# Altium schematic sheet MCU.SchDoc
size A3; DocumentNumber: 5; SheetNumber: 5; SheetTotal: 12
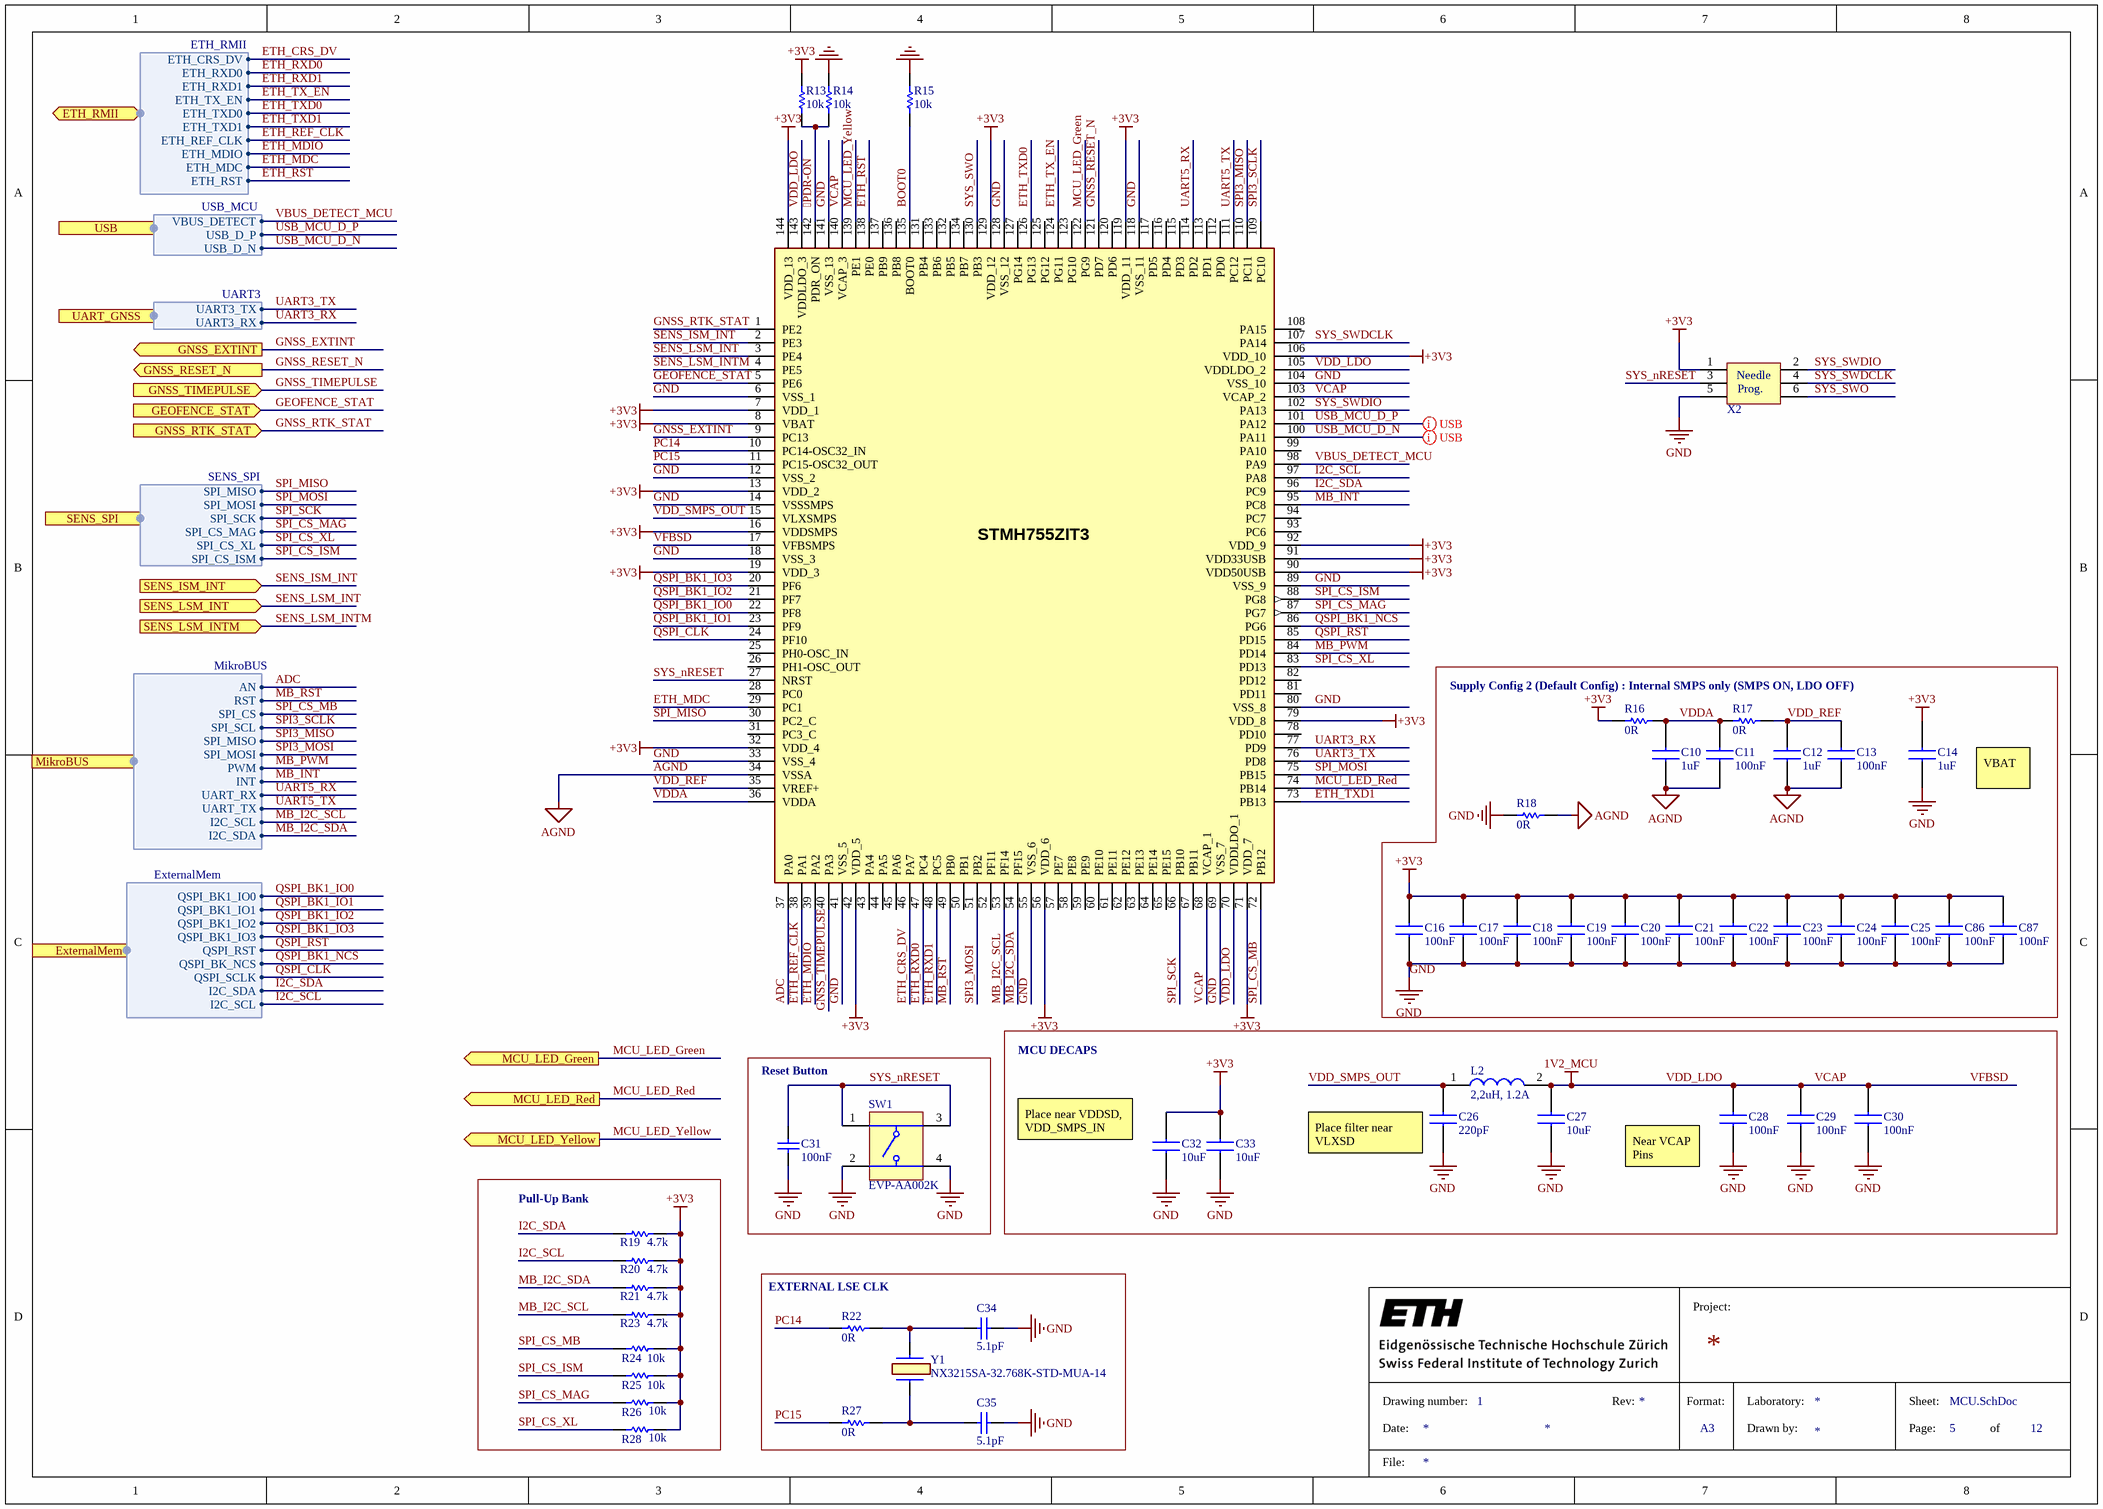
[diagram p0: MCU.SchDoc]

## Parts
C10  1uF  [CAPC1608X90N]
C11  100nF  [CAPC1608X90N]
C12  1uF  [CAPC1608X90N]
C13  100nF  [CAPC1608X90N]
C14  1uF  [CAPC1608X90N]
C16  100nF  [CAPC1608X90N]
C17  100nF  [CAPC1608X90N]
C18  100nF  [CAPC1608X90N]
C19  100nF  [CAPC1608X90N]
C20  100nF  [CAPC1608X90N]
C21  100nF  [CAPC1608X90N]
C22  100nF  [CAPC1608X90N]
C23  100nF  [CAPC1608X90N]
C24  100nF  [CAPC1608X90N]
C25  100nF  [CAPC1608X90N]
C26  220pF  [CAPC1608X87N]
C27  10uF  [CAPC2013X140N]
C28  100nF  [CAPC1608X90N]
C29  100nF  [CAPC1608X90N]
C30  100nF  [CAPC1608X90N]
C31  100nF  [CAPC1005X55X25ML05T10]
C32  10uF  [CAPC2013X140N]
C33  10uF  [CAPC2013X140N]
C34  5.1pF  [CAPC1005X55X25NL05T10]
C35  5.1pF  [CAPC1005X55X25NL05T10]
C86  100nF  [CAPC1608X90N]
C87  100nF  [CAPC1608X90N]
IC1  STM32H755ZIT3  [QFP50P2200X2200X160-144N]  (value not drawn)
L2  2,2uH, 1.2A  [LQM2MPN1R0NG0L]
R13  10k  [RESC2012X70N]
R14  10k  [RESC2012X70N]
R15  10k  [RESC2012X70N]
R16  0R  [RESC1005X40X25LL05T10]
R17  0R  [RESC1005X40X25LL05T10]
R18  0R  [RESC1005X40X25LL05T10]
R19  4.7k  [RESC1005X40X25LL05T05]
R20  4.7k  [RESC1005X40X25LL05T05]
R21  4.7k  [RESC1005X40X25LL05T05]
R22  0R  [RESC1005X40X25LL05T10]
R23  4.7k  [RESC1005X40X25LL05T05]
R24  10k  [RESC2012X70N]
R25  10k  [RESC2012X70N]
R26  10k  [RESC2012X70N]
R27  0R  [RESC1005X40X25LL05T10]
R28  10k  [RESC2012X70N]
SW1  EVP-AA002K  [PNSC-EVPAA_V]
X2  TC2030-MCP-NL  [6-Pin_Needle_Programmer]  (value not drawn)  (no BOM)
Y1  NX3215SA-32.768K-STD-MUA-14  [NX3215SA32768KSTDMUA8]

## Blocks framed on the sheet
MCU DECAPS: C26-C30 C32 C33 L2
Reset Button: C31 SW1
Pull-Up Bank: R19-R21 R23-R26 R28
EXTERNAL LSE CLK: C34 C35 R22 R27 Y1

## Ports
ETH_RMII (bidir, harness ETH_RMII, see MAIN[4C], ETH[1A]), ExternalMem (harness ExternalMem, see MAIN[5A], Memory[1A]), GEOFENCE_STAT (in, see MAIN[5B], GNSS_ZED-X20P[2B], IndicatorLEDs[2A]), GNSS_EXTINT (out, see MAIN[5B], GNSS_ZED-X20P[1C]), GNSS_RESET_N (out, see MAIN[5B], GNSS_ZED-X20P[1C]), GNSS_RTK_STAT (in, see MAIN[5B], GNSS_ZED-X20P[2B], IndicatorLEDs[2A]), GNSS_TIMEPULSE (in, see MAIN[5B], GNSS_ZED-X20P[2B]), MCU_LED_Green (out, see MAIN[4D], IndicatorLEDs[1C]), MCU_LED_Red (out, see MAIN[4D], IndicatorLEDs[1C]), MCU_LED_Yellow (out, see MAIN[4D], IndicatorLEDs[1D]), MikroBUS (harness MikroBUS, see MAIN[4A], Mikro_Bus[1B]), SENS_ISM_INT (in, see MAIN[5A], SENS_MEMS[2B]), SENS_LSM_INT (in, see MAIN[5A], SENS_MEMS[3C]), SENS_LSM_INTM (in, see MAIN[5A], SENS_MEMS[3C]), SENS_SPI (harness SENS_SPI, see MAIN[5A], SENS_MEMS[1A]), UART_GNSS (harness UART3, see MAIN[5B], GNSS_ZED-X20P[1A]), USB (harness USB_MCU, see MAIN[5C], USB_C_MCU[4B])

## Harnesses
ETH_RMII: ETH_REF_CLK, ETH_MDIO, ETH_MDC, ETH_CRS_DV, ETH_TX_EN, ETH_RXD0, ETH_RXD1, ETH_TXD0, ETH_TXD1, ETH_RST
USB_MCU: USB_D_P, USB_D_N, VBUS_DETECT
ExternalMem: QSPI_BK1_IO0, QSPI_BK1_IO1, QSPI_BK1_IO2, QSPI_BK1_IO3, QSPI_RST, QSPI_BK_NCS, QSPI_SCLK, I2C_SDA, I2C_SCL
SENS_SPI: SPI_SCK, SPI_MOSI, SPI_MISO, SPI_CS_MAG, SPI_CS_ISM, SPI_CS_XL
UART3: UART3_TX, UART3_RX
MikroBUS: AN, RST, SPI_CS, SPI_SCL, SPI_MISO, SPI_MOSI, PWM, INT, UART_RX, UART_TX, I2C_SCL, I2C_SDA

## Nets
+3V3: C14.2 C16.2 C17.2 C18.2 C19.2 C20.2 C21.2 C22.2 C23.2 C24.2 C25.2 C32.2 C33.2 C86.2 C87.2 IC1.7(VDD_1) IC1.8(VBAT) IC1.13(VDD_2) IC1.16(VDDSMPS) IC1.19(VDD_3) IC1.32(VDD_4) IC1.42(VDD_5) IC1.56(VDD_6) IC1.71(VDD_7) IC1.79(VDD_8) IC1.90(VDD50USB) IC1.91(VDD33USB) IC1.92(VDD_9) IC1.106(VDD_10) IC1.119(VDD_11) IC1.129(VDD_12) IC1.144(VDD_13) R13.2 R16.1 R19.2 R20.2 R21.2 R23.2 R24.2 R25.2 R26.2 R28.2 X2.1
AGND: C10.1 C11.1 C12.1 C13.1 IC1.34(VSSA) R18.2
GND: C14.1 C16.1 C17.1 C18.1 C19.1 C20.1 C21.1 C22.1 C23.1 C24.1 C25.1 C26.2 C27.1 C28.1 C29.1 C30.1 C31.1 C32.1 C33.1 C34.2 C35.2 C86.1 C87.1 IC1.6(VSS_1) IC1.12(VSS_2) IC1.14(VSSSMPS) IC1.18(VSS_3) IC1.33(VSS_4) IC1.41(VSS_5) IC1.55(VSS_6) IC1.69(VSS_7) IC1.80(VSS_8) IC1.89(VSS_9) IC1.104(VSS_10) IC1.118(VSS_11) IC1.128(VSS_12) IC1.141(VSS_13) R14.2 R15.2 R18.1 SW1.2(B) SW1.4(B') X2.5
VCAP: C27.2 C28.2 C29.2 C30.2 IC1.17(VFBSMPS) IC1.68(VCAP_1) IC1.70(VDDLDO_1) IC1.103(VCAP_2) IC1.105(VDDLDO_2) IC1.140(VCAP_3) IC1.143(VDDLDO_3) L2.2  [also labelled 1V2_MCU, VDD_LDO, VFBSD]
PDR-ON: IC1.142(PDR_ON) R13.1 R14.1
ADC: IC1.37(PA0) ; port MikroBUS.AN
BOOT0: IC1.135(BOOT0) R15.1
ETH_CRS_DV: IC1.46(PA7) ; port ETH_RMII.ETH_CRS_DV
ETH_MDC: IC1.29(PC1) ; port ETH_RMII.ETH_MDC
ETH_MDIO: IC1.39(PA2) ; port ETH_RMII.ETH_MDIO
ETH_REF_CLK: IC1.38(PA1) ; port ETH_RMII.ETH_REF_CLK
ETH_RST: IC1.138(PE0) ; port ETH_RMII.ETH_RST
ETH_RXD0: IC1.47(PC4) ; port ETH_RMII.ETH_RXD0
ETH_RXD1: IC1.48(PC5) ; port ETH_RMII.ETH_RXD1
ETH_TX_EN: IC1.124(PG11) ; port ETH_RMII.ETH_TX_EN
ETH_TXD0: IC1.126(PG13) ; port ETH_RMII.ETH_TXD0
ETH_TXD1: IC1.73(PB13) ; port ETH_RMII.ETH_TXD1
GEOFENCE_STAT: IC1.5(PE6) ; port GEOFENCE_STAT
GNSS_EXTINT: IC1.9(PC13) ; port GNSS_EXTINT
GNSS_RESET_N: IC1.121(PD7) ; port GNSS_RESET_N
GNSS_RTK_STAT: IC1.1(PE2) ; port GNSS_RTK_STAT
GNSS_TIMEPULSE: IC1.40(PA3) ; port GNSS_TIMEPULSE
I2C_SCL: IC1.97(PA8) R20.1 ; port ExternalMem.I2C_SCL
I2C_SDA: IC1.96(PC9) R19.1 ; port ExternalMem.I2C_SDA
MB_I2C_SCL: IC1.53(PF14) R23.1 ; port MikroBUS.I2C_SCL
MB_I2C_SDA: IC1.54(PF15) R21.1 ; port MikroBUS.I2C_SDA
MB_INT: IC1.95(PC8) ; port MikroBUS.INT
MB_PWM: IC1.84(PD14) ; port MikroBUS.PWM
MB_RST: IC1.49(PB0) ; port MikroBUS.RST
MCU_LED_Green: IC1.122(PG9) ; port MCU_LED_Green
MCU_LED_Red: IC1.74(PB14) ; port MCU_LED_Red
MCU_LED_Yellow: IC1.139(PE1) ; port MCU_LED_Yellow
PC14: IC1.10(PC14-OSC32_IN) R22.1
PC15: IC1.11(PC15-OSC32_OUT) R27.1
QSPI_BK1_IO0: IC1.22(PF8) ; port ExternalMem.QSPI_BK1_IO0
QSPI_BK1_IO1: IC1.23(PF9) ; port ExternalMem.QSPI_BK1_IO1
QSPI_BK1_IO2: IC1.21(PF7) ; port ExternalMem.QSPI_BK1_IO2
QSPI_BK1_IO3: IC1.20(PF6) ; port ExternalMem.QSPI_BK1_IO3
QSPI_BK1_NCS: IC1.86(PG6) ; port ExternalMem.QSPI_BK_NCS
QSPI_CLK: IC1.24(PF10) ; port ExternalMem.QSPI_SCLK
QSPI_RST: IC1.85(PD15) ; port ExternalMem.QSPI_RST
SENS_ISM_INT: IC1.2(PE3) ; port SENS_ISM_INT
SENS_LSM_INT: IC1.3(PE4) ; port SENS_LSM_INT
SENS_LSM_INTM: IC1.4(PE5) ; port SENS_LSM_INTM
SPI3_MISO: IC1.110(PC11) ; port MikroBUS.SPI_MISO
SPI3_MOSI: IC1.51(PB2) ; port MikroBUS.SPI_MOSI
SPI3_SCLK: IC1.109(PC10) ; port MikroBUS.SPI_SCL
SPI_CS_ISM: IC1.88(PG8) R25.1 ; port SENS_SPI.SPI_CS_ISM
SPI_CS_MAG: IC1.87(PG7) R26.1 ; port SENS_SPI.SPI_CS_MAG
SPI_CS_MB: IC1.72(PB12) R24.1 ; port MikroBUS.SPI_CS
SPI_CS_XL: IC1.83(PD13) R28.1 ; port SENS_SPI.SPI_CS_XL
SPI_MISO: IC1.30(PC2_C) ; port SENS_SPI.SPI_MISO
SPI_MOSI: IC1.75(PB15) ; port SENS_SPI.SPI_MOSI
SPI_SCK: IC1.66(PB10) ; port SENS_SPI.SPI_SCK
SYS_nRESET: C31.2 IC1.27(NRST) SW1.1(A) SW1.3(A') X2.3
SYS_SWDCLK: IC1.107(PA14) X2.4
SYS_SWDIO: IC1.102(PA13) X2.2
SYS_SWO: IC1.130(PB3) X2.6
UART3_RX: IC1.77(PD9) ; port UART_GNSS.UART3_RX
UART3_TX: IC1.76(PD8) ; port UART_GNSS.UART3_TX
UART5_RX: IC1.114(PD2) ; port MikroBUS.UART_RX
UART5_TX: IC1.111(PC12) ; port MikroBUS.UART_TX
USB_MCU_D_N: IC1.100(PA11) ; port USB.USB_D_N
USB_MCU_D_P: IC1.101(PA12) ; port USB.USB_D_P
VBUS_DETECT_MCU: IC1.98(PA9) ; port USB.VBUS_DETECT
VDD_REF: C12.2 C13.2 IC1.35(VREF+) R17.2
VDD_SMPS_OUT: C26.1 IC1.15(VLXSMPS) L2.1
VDDA: C10.2 C11.2 IC1.36(VDDA) R16.2 R17.1
NetC34_1: C34.1 R22.2 Y1.1
NetC35_1: C35.1 R27.2 Y1.2(CRYSTAL_2)

Not connected (* = marked no-connect by the designer): IC1 25(PH0-OSC_IN) 26(PH1-OSC_OUT) 28(PC0) 31(PC3_C) 43(PA4) 44(PA5) 45(PA6) 50(PB1) 52(PF11) 57(PE7) 58(PE8) 59(PE9) 60(PE10) 61(PE11) 62(PE12) 63(PE13) 64(PE14) 65(PE15) 67(PB11) 78(PD10) 81(PD11) 82(PD12) 93(PC6) 94(PC7) 99(PA10) 108(PA15) 112(PD0) 113(PD1) 115(PD3) 116(PD4) 117(PD5) 120(PD6) 123(PG10) 125(PG12) 127(PG14) 131(PB4) 132(PB5) 133(PB6) 134(PB7) 136(PB8) 137(PB9)

## Layout directives
differential pair; differential pair class USB_90R; rule Matched Net Lengths [Tolerance = 100mil]; net class USB_90R: USB_MCU_D_N, USB_MCU_D_P

## Notes on the sheet
- (near IC1) STMH755ZIT3
- Supply Config 2 (Default Config) : Internal SMPS only (SMPS ON, LDO OFF)
- VBAT
- (near C32) Place near VDDSD, VDD_SMPS_IN
- (near C26) Place filter near VLXSD
- (near C28) Near VCAP Pins
- Project:
- Drawing number:
- Date:
- 1
- Rev:
- Format:
- A3
- Laboratory:
- Drawn by:
- Sheet:
- Page:
- of
- File:
- (in symbol 6-Pin_Needle_Programmer) Needle; Prog.

## Library data of the parts
C10 C12 C14 = CL10B105KP8NNNC: Capacitor 1uF 0603; Manufacturer_Name: SAMSUNG; Datasheet Link: https://media.digikey.com/pdf/Data%20Sheets/Samsung%20PDFs/CL_Series_MLCC_ds.pdf; Height: 0.9mm; Mouser Part Number: 187-CL10B105KP8NNNC; Mouser Price/Stock: https://www.mouser.co.uk/ProductDetail/Samsung-Electro-Mechanics/CL10B105KP8NNNC?qs=X6jEic%2FHinD9krOsbkFZow%3D%3D; Arrow Part Number: CL10B105KP8NNNC; Arrow Price/Stock: https://www.arrow.com/en/products/cl10b105kp8nnnc/samsung-electro-mechanics?region=europe; Supplier 1: Digikey; Supplier Part Number 1: 1276-1946-1-ND; Manufacturer Part Number: CL10B105KP8NNNC
C11 C13 C16-C25 C28-C30 C86 C87 = CC0603KRX7R7BB104: Capacitor 100nF 0603; Manufacturer_Name: YAGEO; Datasheet Link: https://www.yageo.com/en/Chart/Download/pdf/CC0603KRX7R7BB104; Height: 0.9mm; Mouser Part Number: 603-CC603KRX7R7BB104; Mouser Price/Stock: https://www.mouser.co.uk/ProductDetail/YAGEO/CC0603KRX7R7BB104?qs=AgBp2OyFlx8KPmNTlFoWXA%3D%3D; Arrow Part Number: CC0603KRX7R7BB104; Arrow Price/Stock: https://www.arrow.com/en/products/cc0603krx7r7bb104/yageo?utm_currency=USD&region=europe; Manufacturer Part Number: CC0603KRX7R7BB104; Supplier 1: Mouser; Supplier Part Number 1: 603-CC603KRX7R7BB104
C26 = 0603B221K500CT: Capacitor 220pF 0603; Manufacturer_Name: Walsin Technology Corporation; Datasheet Link: http://www.passivecomponent.com/wp-content/uploads/datasheet/WTC_MLCC_General_Purpose.pdf; Height: 0.87mm; Supplier 1: Digikey; Supplier Part Number 1: 1292-1407-1-ND; Manufacturer Part Number: 0603B221K500CT
C27 C32 C33 = LMK212AB7106MG-T: Capacitor 10uF 0805; Manufacturer_Name: TAIYO YUDEN; Datasheet Link: https://datasheet.datasheetarchive.com/originals/distributors/Datasheets-DGA20/25674.pdf; Height: 1.4mm; Mouser Part Number: 963-LMK212AB7106MG-T; Mouser Price/Stock: https://www.mouser.co.uk/ProductDetail/Taiyo-Yuden/LMK212AB7106MG-T?qs=CNQs48zzdnrud19jlu61Cg%3D%3D; Supplier 1: Digikey; Supplier Part Number 1: 587-3417-1-ND; Manufacturer Part Number: LMK212AB7106MG-T
C31 = GRM155R71H104KE14J: Capacitor 100nF 0402 - storage; Manufacturer: Murata; Tolerance: 10%; Dielectric: X7R; Voltage Rating (DC): 50V; Supplier 1: Digi-Key; Manufacturer Part Number: GRM155R71H104KE14J; RoHS: Yes; Category: Ceramic Capacitors; Stock 1: 1916144; Pricing 1: 1=0.10000, 10=0.03800, 100=0.01680, 500=0.01198, 1000=0.00941, 2500=0.00855, 5000=0.00787 (USD); Mount: Surface Mount; Case/Package: 0402; Weight: 0.000212oz; Case Code (Imperial): 0402; Case Code (Metric): 1005; Min Operating Temperature: -55°C; Max Operating Temperature: 125°C; Termination: SMD/SMT; Composition: Ceramic; Package Quantity: 50000; Packaging: Tape and Reel; Value: 100nF; Voltage Rating: 50V; Length: 0.039inch; Height: 0.5mm; Width: 0.5mm; Thickness: 0.022inch; Lead Free: Lead Free; ComponentLink1URL: http://search.murata.co.jp/Ceramy/image/img/A01X/G101/ENG/GRM155R71H104KE14-01.pdf?src-supplier=Mouser; ComponentLink1Description: http://search.murata.co.jp/Ceramy/image/img/A01X/G101/ENG/GRM155R71H104KE14-01.pdf?src-supplier=Mouser; ComponentLink2URL: http://search.murata.co.jp/Ceramy/image/img/A01X/G101/ENG/GRM155R71H104KE14-01.pdf?src-supplier=Digi-Key; ComponentLink2Description: http://search.murata.co.jp/Ceramy/image/img/A01X/G101/ENG/GRM155R71H104KE14-01.pdf?src-supplier=Digi-Key; ComponentLink3URL: http://search.murata.co.jp/Ceramy/image/img/A01X/G101/ENG/GRM155R71H104KE14-01.pdf?src-supplier=Avnet; ComponentLink3Description: http://search.murata.co.jp/Ceramy/image/img/A01X/G101/ENG/GRM155R71H104KE14-01.pdf?src-supplier=Avnet; ComponentLink4URL: http://search.murata.co.jp/Ceramy/image/img/A01X/G101/ENG/GRM155R71H104KE14-01.pdf?src-supplier=Avnet+Europe; ComponentLink4Description: http://search.murata.co.jp/Ceramy/image/img/A01X/G101/ENG/GRM155R71H104KE14-01.pdf?src-supplier=Avnet+Europe; Supplier Part Number 1: 490-13342-1-ND
C34 C35 = CMP-2008-04393-1: Manufacturer: Murata; Part Number: GRM1555C1H5R1CA01D
IC1 = STM32H755ZIT6U: STM32H755 MCU; Manufacturer_Name: STMicroelectronics; Datasheet Link: https://www.st.com/resource/en/datasheet/stm32h755zi.pdf; Height: 1.6mm; Mouser Part Number: 511-STM32H755ZIT3; Mouser Price/Stock: https://www.mouser.com/Search/Refine.aspx?Keyword=511-STM32H755ZIT6U; Supplier 1: Heisener; Supplier Part Number 1: STM32H755ZIT3; Manufacturer Part Number: STM32H755ZIT3
L2 = LQM2MPN2R2MG0L: Inductor; Manufacturer_Name: Murata Electronics; Datasheet Link: https://search.murata.co.jp/Ceramy/image/img/P02/JELF243B-0022.pdf; Height: 1mm; Mouser Part Number: 81-LQM2MPN2R2MG0L; Mouser Price/Stock: https://www.mouser.co.uk/ProductDetail/Murata-Electronics/LQM2MPN2R2MG0L?qs=YinlzBdtFMj9%2Fj5t8GanUg%3D%3D; Arrow Part Number: LQM2MPN2R2MG0L; Arrow Price/Stock: https://www.arrow.com/en/products/lqm2mpn2r2mg0l/murata-manufacturing?utm_currency=USD&region=nac; Supplier 1: Mouser; Supplier Part Number 1: 81-LQM2MPN2R2MG0L; Manufacturer Part Number: LQM2MPN2R2MG0L
R13-R15 R24-R26 R28 = ERJ-6GEYJ103V: Resistor 10k 0805; Manufacturer_Name: Panasonic; Datasheet Link: https://datasheet.datasheetarchive.com/originals/distributors/DKDS40/DSANUWW0010911.pdf; Height: 0.7mm; Mouser Part Number: 667-ERJ-6GEYJ103V; Mouser Price/Stock: https://www.mouser.co.uk/ProductDetail/Panasonic/ERJ-6GEYJ103V?qs=tQNqqtTOejK5rw%252BRxJVxUA%3D%3D; Arrow Part Number: ERJ-6GEYJ103V; Arrow Price/Stock: https://www.arrow.com/en/products/erj6geyj103v/panasonic?region=nac; Supplier 1: Mouser; Supplier Part Number 1: 71-CRCW0603-10K-E3; Supplier 2: Digikey; Supplier Part Number 2: P10KADKR-ND; Manufacturer Part Number: ERJ-6GEYJ103V
R16-R18 R22 R27 = CMP-2002-03041-1: Resistor 0R 0402; Part Number: CRCW04020000Z0EDHP; Manufacturer: Vishay Dale; Value: 0Ohm; Voltage Rating: 50V; Power Rating: 200mW; Temperature Coefficient: 0ppm/°C; Max Power Dissipation: 125mW; Supplier 1: Digi-Key; Supplier Part Number 1: 541-0.0YBCT-ND; Manufacturer Part Number: CRCW04020000Z0EDHP; RoHS: Yes; Category: Chip SMD Resistors; Stock 1: 527407; Pricing 1: 1=0.13000, 10=0.11300, 25=0.07840, 50=0.06080, 100=0.04350, 250=0.03388, 500=0.02694, 1000=0.01912, 5000=0.01477 (USD); Mount: Surface Mount; Case/Package: 0402; Weight: 2.3E-05oz; Case Code (Metric): 1005; Case Code (Imperial): 0402; Contact Plating: Tin; Min Operating Temperature: -55°C; Max Operating Temperature: 155°C; Packaging: Tape and Reel; Composition: Thick Film; Termination: SMD/SMT; Voltage Rating (DC): 50V; Package Quantity: 1; Military Standard: Not; Number of Terminations: 2; Features: Automotive AEC-Q200; Length: 1mm; Height: 0.3mm; Width: 0.02inch; Depth: 0.5mm; Radiation Hardening: No; REACH SVHC: Unknown; Lead Free: Lead Free; ComponentLink1URL: https://datasheet.ciiva.com/16494/crcwhpe3-16494453.pdf?src-supplier=Future+Electronics; ComponentLink1Description: https://datasheet.ciiva.com/16494/crcwhpe3-16494453.pdf?src-supplier=Future+Electronics; ComponentLink2URL: https://datasheet.ciiva.com/2470/crcwhpe3-2470555.pdf?src-supplier=Digi-Key; ComponentLink2Description: https://datasheet.ciiva.com/2470/crcwhpe3-2470555.pdf?src-supplier=Digi-Key; ComponentLink3URL: https://datasheet.ciiva.com/5562/crcwhpe3-46056-5562315.pdf?src-supplier=Mouser; ComponentLink3Description: https://datasheet.ciiva.com/5562/crcwhpe3-46056-5562315.pdf?src-supplier=Mouser; ComponentLink4URL: https://datasheet.ciiva.com/9109/crcwhpe3-9109963.pdf?src-supplier=Avnet; ComponentLink4Description: https://datasheet.ciiva.com/9109/crcwhpe3-9109963.pdf?src-supplier=Avnet; ComponentLink5URL: https://datasheet.ciiva.com/2470/crcwhpe3-2470556.pdf?src-supplier=Digi-Key; ComponentLink5Description: https://datasheet.ciiva.com/2470/crcwhpe3-2470556.pdf?src-supplier=Digi-Key; ComponentLink6URL: https://datasheet.ciiva.com/28621/1912814-28621324.pdf?src-supplier=Element14; ComponentLink6Description: https://datasheet.ciiva.com/28621/1912814-28621324.pdf?src-supplier=Element14; ComponentLink7URL: https://datasheet.ciiva.com/2470/crcwhpe3-2470557.pdf?src-supplier=Digi-Key; ComponentLink7Description: https://datasheet.ciiva.com/2470/crcwhpe3-2470557.pdf?src-supplier=Digi-Key; ComponentLink8URL: https://datasheet.ciiva.com/7725/crcwhpe3-7725758.pdf?src-supplier=Element14; ComponentLink8Description: https://datasheet.ciiva.com/7725/crcwhpe3-7725758.pdf?src-supplier=Element14
R19-R21 R23 = CMP-1011-00090-2: Part Number: CRCW04024K70JNTD; Manufacturer: Vishay Dale
SW1 = CMP-2000-06231-1: Light Touch Switch, 100 mOhm, -40 to 85 degC, 4-Pin SMD, RoHS, Tape and Reel; Manufacturer: Panasonic; Electrical Life: 1000000Cycles; Switch Configuration: N.O.; COO: JP; Actuator Color: Black; Contact Rating @ Voltage: 0.02@1+5VDCA; Dielectric Strength: 250VAC; Actuator Length: 0.3mm; Ground Terminal: No; Operating Force: 1N; Pole Throw Configuration: SPST; Body Orientation: Straight; Illumination Type: N/R; Maximum DC Voltage Rating: 1+5V; Actuator Style: RectangularButton; Maximum AC Voltage Rating: N/A; Package Description: 4-Pin Surface Mount Device, Body 2.9 x 3.5 mm, Pitch 1.45 mm; Family: EVPAA; Contact Material: N/A; Mounting: SurfaceMount,J-Bend; Datasheet Version: 04/2016; Housing Material: N/A; Product Weight: N/A; RoHS: Yes; Mechanical Life: N/A; Minimum Insulation Resistance: 100MOhm; Operating Temperature: -40to85C; Mounting Technology: SurfaceMount; HTS: 8507204000; Dimension: 4.3x2.9x1.7mm; Maximum Contact Resistance: 100mOhm; Base Material: N/A; Seal Location: N/A; Supplier Standard Pack: 5,000; Supplier: PanasonicIndustrialDevices; Datasheet URL: https://industrial.panasonic.com/cdbs/www-data/pdf/ATV0000/ATV0000C1.pdf; Packaging: EmbossedTapeandReel; Manufacturer URL: http://www.panasonic.com/; Seal Description: N/A; Contact Plating: N/A; ECCN: EAR99; Package Reference: EVPAA; Type: LightTouch; Part No: EVP-AA002K; Supplier Part Number: P13347SDKR-ND; Manufacturer Part Number: EVP-AA002K; Category: Tactile Switches; Stock: 749; Pricing: 1=0.8, 10=0.774, 25=0.744, 100=0.6459, 250=0.5894, 500=0.54772, 1000=0.49116, 2500=0.46139 (USD); ComponentLink1URL: https://datasheet.ciiva.com/24076/atk0000pe184-69004-24076293.pdf?src-supplier=Mouser; ComponentLink1Description: https://datasheet.ciiva.com/24076/atk0000pe184-69004-24076293.pdf?src-supplier=Mouser; ComponentLink2URL: https://datasheet.ciiva.com/2899/atk0000ce26-2899990.pdf?src-supplier=Digikey; ComponentLink2Description: https://datasheet.ciiva.com/2899/atk0000ce26-2899990.pdf?src-supplier=Digikey; ComponentLink3URL: https://datasheet.ciiva.com/2899/atk0000ce26-2899991.pdf?src-supplier=Digikey; ComponentLink3Description: https://datasheet.ciiva.com/2899/atk0000ce26-2899991.pdf?src-supplier=Digikey; ComponentLink4URL: https://datasheet.ciiva.com/2899/atk0000ce26-2899992.pdf?src-supplier=Digikey; ComponentLink4Description: https://datasheet.ciiva.com/2899/atk0000ce26-2899992.pdf?src-supplier=Digikey
X2 = 6-Pin_Needle_Programmer: CABLE, TAG CONNECT, WITH OUT LEG, FOR IC; Number of Pins: 6; Package Quantity: 1; Packaging: Bulk; REACH SVHC: No SVHC; Lead Free: Lead Free
Y1 = NX3215SA-32.768K-STD-MUA-14: Crystal or Oscillator - 6pF Load; Manufacturer_Name: NDK; Datasheet Link: https://www.arrow.com/en/products/nx3215sa32.768kstdmua8/ndk; Height: 0.9mm; Manufacturer Part Number: NX3215SA-32.768K-STD-MUA-14; Mouser Part Number: 344-NX3215SA32768K8; Mouser Price/Stock: https://www.mouser.co.uk/ProductDetail/NDK/NX3215SA-32.768K-STD-MUA-8?qs=55YtniHzbhBdnrw6egvs7Q%3D%3D; Arrow Part Number: NX3215SA-32.768K-STD-MUA-8; Arrow Price/Stock: https://www.arrow.com/en/products/nx3215sa32.768kstdmua8/ndk; Supplier 1: Mouser; Supplier Part Number 1: 344-NX3215SA32768K8